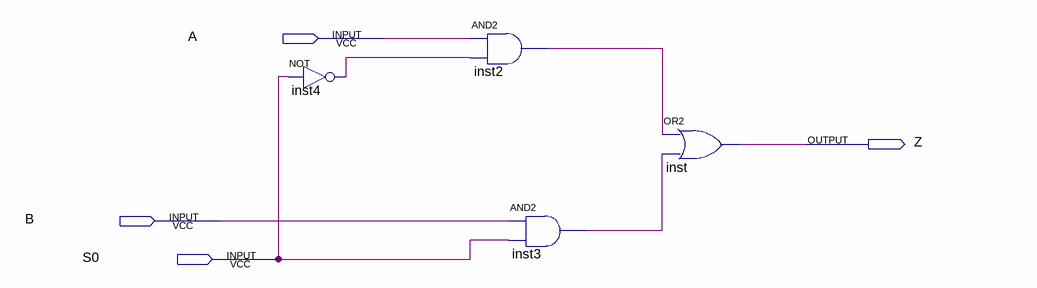
[diagram p0: schematic sheet]
// Quartus schematic MUX21.bdf as structural Verilog: 4 symbols, 4 pins
module MUX21 (
  input  A,
  input  B,
  input  S0,
  output Z
);

  wire inst2_out, inst3_out, inst4_out;

  not inst4 (inst4_out, S0);
  and inst2 (inst2_out, A, inst4_out);
  and inst3 (inst3_out, B, S0);
  or inst (Z, inst2_out, inst3_out);
endmodule
